# Altium schematic sheet C14709_SCH.SchDoc
size 127 x 101 mm
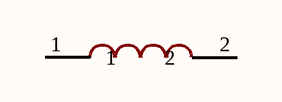
[diagram p0: C14709_SCH.SchDoc]

## Parts
L??  BLM18PG121SN1D  (value not drawn)

## Nets

Not connected (* = marked no-connect by the designer): L?? 1 2

## Library data of the parts
L?? = BLM18PG121SN1D: ???:3.3nH;??:?5%;????:850mA;????(DCR):59m?;